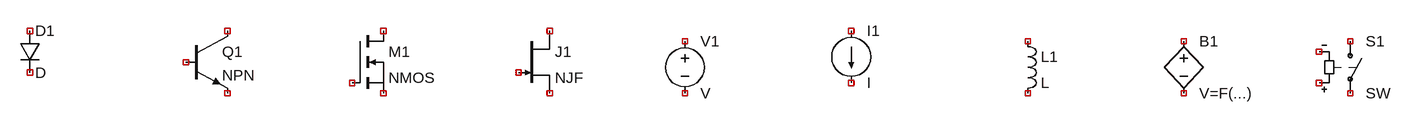
[diagram p0: schematic open_pin_letters.asc]
open_pin_letters.asc, the LTspice schematic file:
Version 4
SHEET 1 2400 680
SYMBOL diode 0 0 R0
SYMATTR InstName D1
SYMBOL npn 256 0 R0
SYMATTR InstName Q1
SYMBOL nmos 512 0 R0
SYMATTR InstName M1
SYMBOL njf 768 0 R0
SYMATTR InstName J1
SYMBOL voltage 1024 0 R0
SYMATTR InstName V1
SYMBOL current 1280 0 R0
SYMATTR InstName I1
SYMBOL ind 1536 0 R0
SYMATTR InstName L1
SYMBOL bv 1792 0 R0
SYMATTR InstName B1
SYMBOL sw 2048 0 R0
SYMATTR InstName S1

The netlist it stands for:
* open_pin_letters.asc
D1 NC_01 NC_02 D
Q1 NC_03 NC_04 NC_05 0 NPN
M1 NC_06 NC_07 NC_08 NC_08 NMOS
J1 NC_09 NC_10 NC_11 NJF
V1 NC_12 NC_13 V
I1 NC_14 NC_15 I
L1 NC_16 NC_17 L
B1 NC_18 NC_19 V=F(...)
S1 NC_20 NC_21 NC_22 NC_23 SW
.model D D
.lib standard.dio
.model NPN NPN
.model PNP PNP
.lib standard.bjt
.model NJF NJF
.model PJF PJF
.lib standard.jft
.model NMOS NMOS
.model PMOS PMOS
.lib standard.mos
.backanno
.end